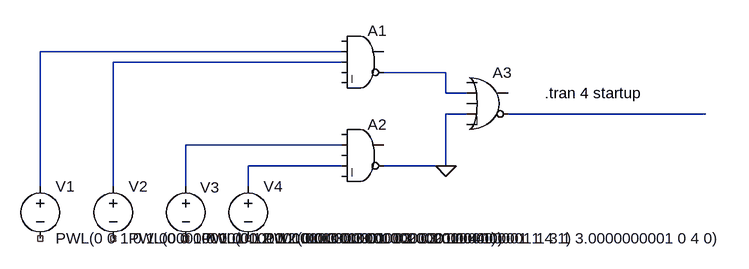
[diagram p0: schematic q46.asc]
q46.asc, the LTspice schematic file:
Version 4.1
SHEET 1 880 680
WIRE 80 96 -384 96
WIRE 80 112 -272 112
WIRE 240 128 144 128
WIRE 240 160 240 128
WIRE 272 160 240 160
WIRE 272 192 240 192
WIRE 640 192 336 192
WIRE 80 240 -160 240
WIRE 80 272 -64 272
WIRE 240 272 240 192
WIRE 240 272 144 272
WIRE -384 304 -384 96
WIRE -272 304 -272 112
WIRE -160 304 -160 240
WIRE -64 304 -64 272
FLAG 240 272 0
SYMBOL Digital\\and 112 48 R0
SYMATTR InstName A1
SYMBOL Digital\\and 112 192 R0
SYMATTR InstName A2
SYMBOL Digital\\or 304 112 R0
SYMATTR InstName A3
SYMBOL voltage -384 288 R0
WINDOW 123 0 0 Left 0
WINDOW 39 0 0 Left 0
SYMATTR InstName V1
SYMATTR Value PWL(0 0 1 0 1.0000000001 1 2 1 2.0000000001 0 3 0 3.0000000001 1 4 1)
SYMBOL voltage -272 288 R0
WINDOW 123 0 0 Left 0
WINDOW 39 0 0 Left 0
SYMATTR InstName V2
SYMATTR Value PWL(0 0 1 0 1.0000000001 1 3 1 3.0000000001 0 4 0)
SYMBOL voltage -160 288 R0
WINDOW 123 0 0 Left 0
WINDOW 39 0 0 Left 0
WINDOW 0 22 17 Left 2
SYMATTR InstName V3
SYMATTR Value PWL(0 1 1 1 1.0000000001 0 2 0 2.0000000001 1 3 1 3.0000000001 0 4 0)
SYMBOL voltage -64 288 R0
WINDOW 123 0 0 Left 0
WINDOW 39 0 0 Left 0
SYMATTR InstName V4
SYMATTR Value PWL(0 0 3 0 3.0000000001 1 4 1)
TEXT 392 160 Left 2 !.tran 4 startup

The netlist it stands for:
* q46.asc
A1 0 N001 N002 0 0 N003 0 0 AND
A2 0 N005 0 N006 0 0 0 0 AND
A3 0 N003 0 0 0 N004 0 0 OR
V1 N001 NC_01 PWL(0 0 1 0 1.0000000001 1 2 1 2.0000000001 0 3 0 3.0000000001 1 4 1)
V2 N002 NC_02 PWL(0 0 1 0 1.0000000001 1 3 1 3.0000000001 0 4 0)
V3 N005 NC_03 PWL(0 1 1 1 1.0000000001 0 2 0 2.0000000001 1 3 1 3.0000000001 0 4 0)
V4 N006 NC_04 PWL(0 0 3 0 3.0000000001 1 4 1)
.tran 4 startup
.backanno
.end